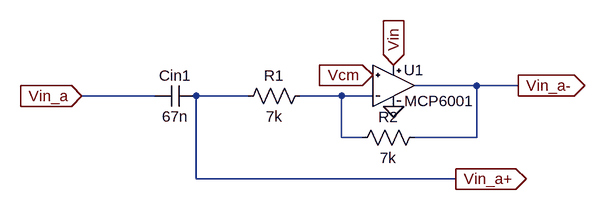
[diagram p0: schematic Exp4_block.asc]
Exp4_block.asc, the LTspice schematic file:
Version 4.1
SHEET 1 880 680
WIRE 416 128 320 128
WIRE 480 128 416 128
WIRE -80 144 -192 144
WIRE 64 144 -16 144
WIRE 208 144 144 144
WIRE 256 144 208 144
WIRE 208 208 208 144
WIRE 240 208 208 208
WIRE 416 208 416 128
WIRE 416 208 320 208
WIRE -16 272 -16 144
WIRE 384 272 -16 272
FLAG -192 144 Vin_a
IOPIN -192 144 In
FLAG 384 272 Vin_a+
IOPIN 384 272 Out
FLAG 480 128 Vin_a-
IOPIN 480 128 Out
FLAG 288 160 0
FLAG 256 112 Vcm
IOPIN 256 112 In
FLAG 288 96 Vin
IOPIN 288 96 In
SYMBOL cap -16 128 R90
WINDOW 0 0 32 VBottom 2
WINDOW 3 32 32 VTop 2
SYMATTR InstName Cin1
SYMATTR Value 67n
SYMBOL res 160 128 R90
WINDOW 0 0 56 VBottom 2
WINDOW 3 32 56 VTop 2
SYMATTR InstName R1
SYMATTR Value 7k
SYMBOL res 336 192 R90
WINDOW 0 0 56 VBottom 2
WINDOW 3 32 56 VTop 2
SYMATTR InstName R2
SYMATTR Value 7k
SYMBOL MCP6001 288 128 R0
SYMATTR InstName U1

The netlist it stands for:
* Exp4_block.asc
Cin1 Vin_a+ Vin_a 67n
R1 N001 Vin_a+ 7k
R2 Vin_a- N001 7k
X§U1 Vcm N001 Vin 0 Vin_a- MCP6001
.lib ./MCP6001.lib
.backanno
.end